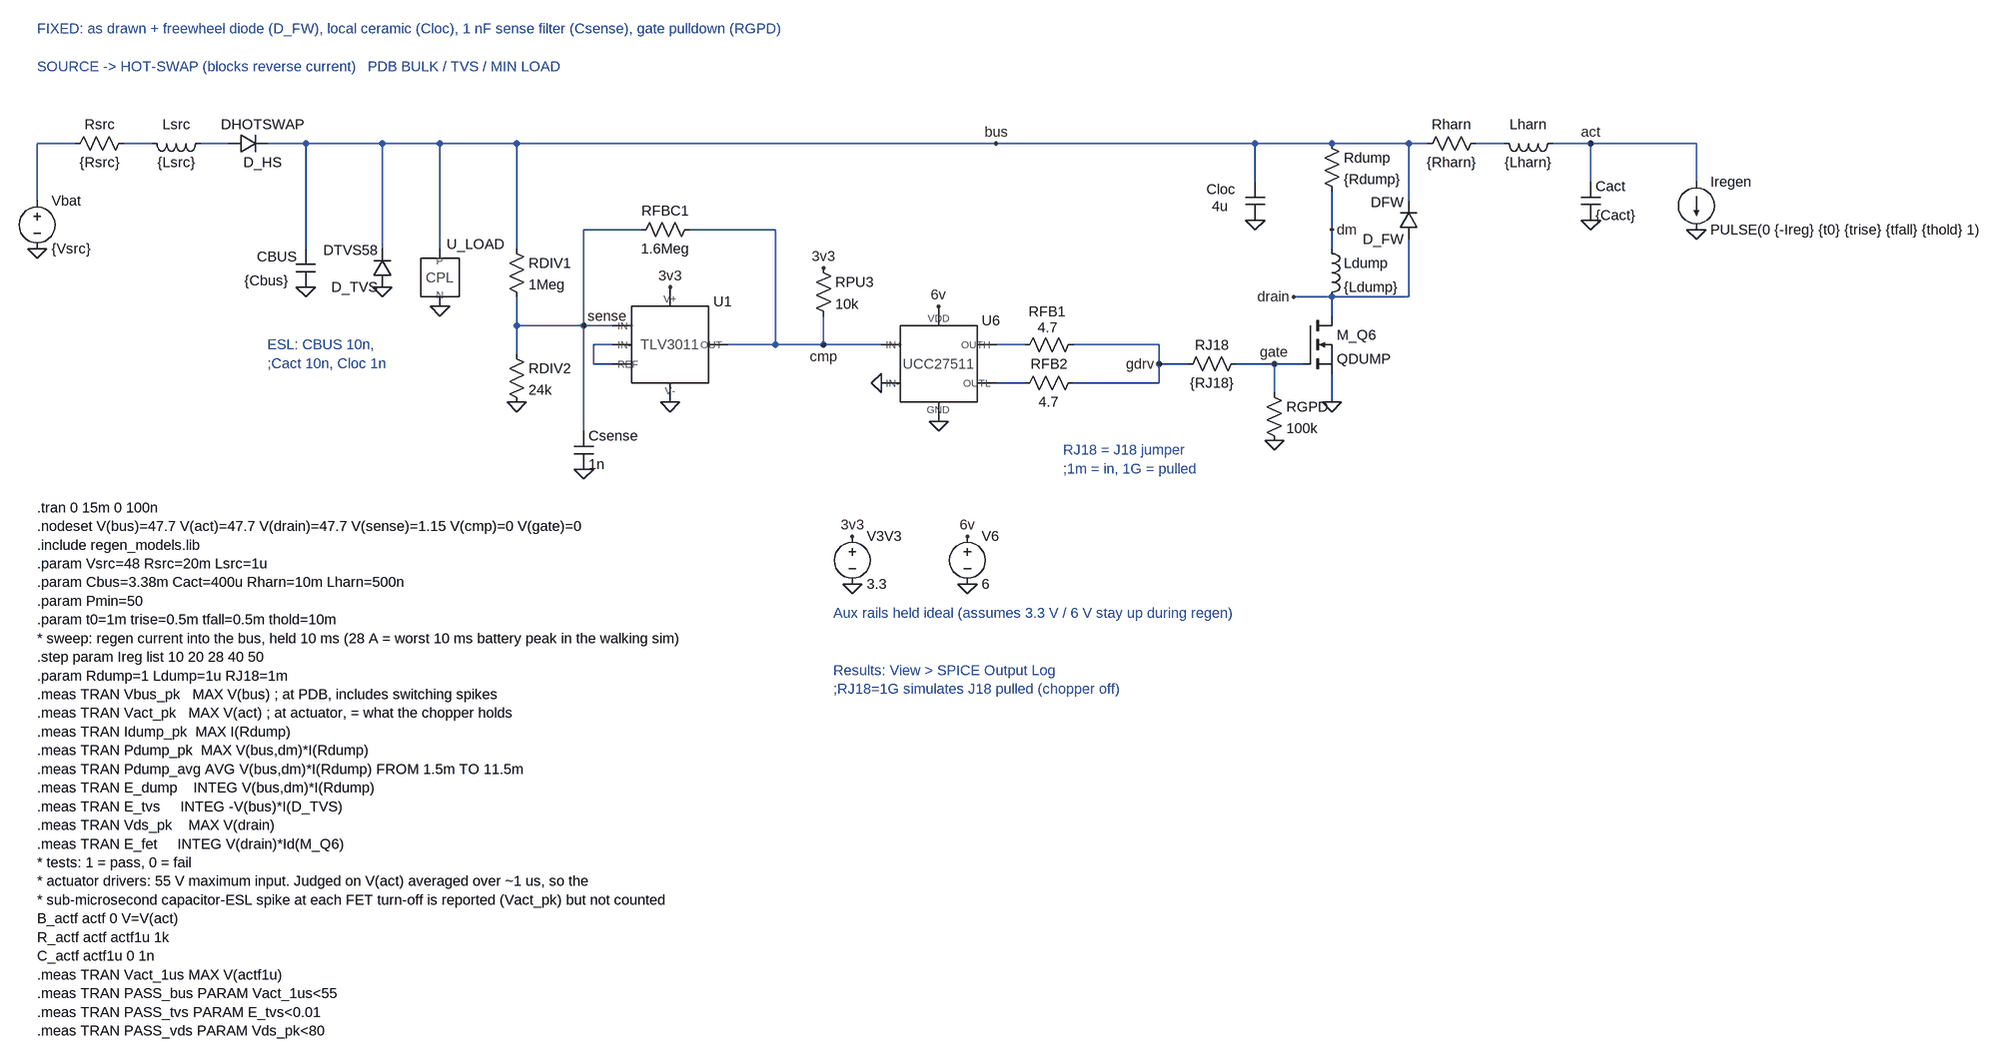
[diagram p0: schematic regen_current_sweep.asc]
regen_current_sweep.asc, the LTspice schematic file:
Version 4.1
SHEET 1 3344 1360
WIRE 64 64 0 64
WIRE 192 64 144 64
WIRE 320 64 272 64
WIRE 448 64 384 64
WIRE 576 64 448 64
WIRE 672 64 576 64
WIRE 800 64 672 64
WIRE 1600 64 800 64
WIRE 2032 64 1600 64
WIRE 2160 64 2032 64
WIRE 2288 64 2160 64
WIRE 2320 64 2288 64
WIRE 2448 64 2400 64
WIRE 2592 64 2528 64
WIRE 2768 64 2592 64
WIRE 2032 128 2032 64
WIRE 2592 128 2592 64
WIRE 2768 128 2768 64
WIRE 0 160 0 64
WIRE 2288 160 2288 64
WIRE 1008 208 912 208
WIRE 1232 208 1088 208
WIRE 2160 208 2160 144
WIRE 448 240 448 64
WIRE 576 240 576 64
WIRE 672 240 672 64
WIRE 800 240 800 64
WIRE 2160 240 2160 208
WIRE 2160 320 2096 320
WIRE 2288 320 2288 224
WIRE 2288 320 2160 320
WIRE 2160 352 2160 320
WIRE 800 368 800 320
WIRE 912 368 912 208
WIRE 912 368 800 368
WIRE 960 368 912 368
WIRE 960 400 928 400
WIRE 1232 400 1232 208
WIRE 1232 400 1152 400
WIRE 1312 400 1312 352
WIRE 1312 400 1232 400
WIRE 1408 400 1312 400
WIRE 1648 400 1600 400
WIRE 1872 400 1728 400
WIRE 800 416 800 368
WIRE 928 432 928 400
WIRE 960 432 928 432
WIRE 1872 432 1872 400
WIRE 1920 432 1872 432
WIRE 2064 432 2000 432
WIRE 2112 432 2064 432
WIRE 1648 464 1600 464
WIRE 1872 464 1872 432
WIRE 1872 464 1728 464
WIRE 2064 480 2064 432
WIRE 2160 496 2160 448
WIRE 912 544 912 368
FLAG 0 240 0
FLAG 1600 64 bus
FLAG 448 304 0
FLAG 576 304 0
FLAG 672 336 0
FLAG 800 496 0
FLAG 912 368 sense
FLAG 1056 304 3v3
FLAG 1056 496 0
FLAG 1312 400 cmp
FLAG 1312 272 3v3
FLAG 1408 464 0
FLAG 1504 336 6v
FLAG 1504 528 0
FLAG 1872 432 gdrv
FLAG 2064 432 gate
FLAG 2160 496 0
FLAG 2160 208 dm
FLAG 2096 320 drain
FLAG 2592 64 act
FLAG 2592 192 0
FLAG 2768 208 0
FLAG 1360 720 3v3
FLAG 1360 800 0
FLAG 1552 720 6v
FLAG 1552 800 0
FLAG 912 608 0
FLAG 2064 560 0
FLAG 2032 192 0
SYMBOL voltage 0 144 R0
SYMATTR InstName Vbat
SYMATTR Value {Vsrc}
SYMBOL res 160 48 R90
WINDOW 0 0 56 VBottom 2
WINDOW 3 32 56 VTop 2
SYMATTR InstName Rsrc
SYMATTR Value {Rsrc}
SYMBOL ind 288 48 R90
WINDOW 0 0 56 VBottom 2
WINDOW 3 32 56 VTop 2
SYMATTR InstName Lsrc
SYMATTR Value {Lsrc}
SYMBOL diode 320 80 R270
WINDOW 0 0 56 VBottom 2
WINDOW 3 32 56 VTop 2
SYMATTR InstName D_HS
SYMATTR Value DHOTSWAP
SYMBOL cap 432 240 R0
WINDOW 0 -65 13 Left 2
WINDOW 3 -86 53 Left 2
SYMATTR InstName CBUS
SYMATTR Value {Cbus}
SYMATTR SpiceLine Rser=10m Lser=10n
SYMBOL diode 592 304 R180
WINDOW 3 24 62 Left 2
SYMATTR Value DTVS58
SYMATTR InstName D_TVS
SYMBOL CPL_beh 672 240 R0
WINDOW 0 11 -8 Left 2
SYMATTR InstName U_LOAD
SYMBOL res 784 224 R0
SYMATTR InstName RDIV1
SYMATTR Value 1Meg
SYMBOL res 784 400 R0
SYMATTR InstName RDIV2
SYMATTR Value 24k
SYMBOL res 1104 192 R90
WINDOW 0 0 56 VBottom 2
WINDOW 3 32 56 VTop 2
SYMATTR InstName RFBC1
SYMATTR Value 1.6Meg
SYMBOL TLV3011_beh 1056 400 R0
SYMATTR InstName U1
SYMBOL res 1296 256 R0
SYMATTR InstName RPU3
SYMATTR Value 10k
SYMBOL UCC27511_beh 1504 432 R0
SYMATTR InstName U6
SYMBOL res 1744 384 R90
WINDOW 0 -24 59 VBottom 2
WINDOW 3 -28 58 VTop 2
SYMATTR InstName RFB1
SYMATTR Value 4.7
SYMBOL res 1744 448 R90
WINDOW 0 0 56 VBottom 2
WINDOW 3 32 56 VTop 2
SYMATTR InstName RFB2
SYMATTR Value 4.7
SYMBOL res 2016 416 R90
WINDOW 0 0 56 VBottom 2
WINDOW 3 32 56 VTop 2
SYMATTR InstName RJ18
SYMATTR Value {RJ18}
SYMBOL nmos 2112 352 R0
SYMATTR InstName M_Q6
SYMATTR Value QDUMP
SYMBOL res 2144 48 R0
SYMATTR InstName Rdump
SYMATTR Value {Rdump}
SYMBOL ind 2144 224 R0
SYMATTR InstName Ldump
SYMATTR Value {Ldump}
SYMBOL res 2416 48 R90
WINDOW 0 0 56 VBottom 2
WINDOW 3 32 56 VTop 2
SYMATTR InstName Rharn
SYMATTR Value {Rharn}
SYMBOL ind 2544 48 R90
WINDOW 0 0 56 VBottom 2
WINDOW 3 32 56 VTop 2
SYMATTR InstName Lharn
SYMATTR Value {Lharn}
SYMBOL cap 2576 128 R0
SYMATTR InstName Cact
SYMATTR Value {Cact}
SYMATTR SpiceLine Rser=20m Lser=10n
SYMBOL current 2768 128 R0
SYMATTR InstName Iregen
SYMATTR Value PULSE(0 {-Ireg} {t0} {trise} {tfall} {thold} 1)
SYMBOL voltage 1360 704 R0
SYMATTR InstName V3V3
SYMATTR Value 3.3
SYMBOL voltage 1552 704 R0
SYMATTR InstName V6
SYMATTR Value 6
SYMBOL cap 896 544 R0
SYMATTR InstName Csense
SYMATTR Value 1n
SYMBOL res 2048 464 R0
SYMATTR InstName RGPD
SYMATTR Value 100k
SYMBOL cap 2016 128 R0
WINDOW 0 -65 13 Left 2
WINDOW 3 -56 41 Left 2
SYMATTR InstName Cloc
SYMATTR Value 4u
SYMATTR SpiceLine Rser=5m Lser=1n
SYMBOL diode 2304 224 R180
WINDOW 3 24 62 Left 2
SYMATTR Value DFW
SYMATTR InstName D_FW
TEXT 0 -64 Left 2 ;SOURCE -> HOT-SWAP (blocks reverse current)
TEXT 552 -64 Left 2 ;PDB BULK / TVS / MIN LOAD
TEXT 1712 576 Left 2 ;RJ18 = J18 jumper\n;1m = in, 1G = pulled
TEXT 384 400 Left 2 ;ESL: CBUS 10n,\n;Cact 10n, Cloc 1n
TEXT 0 -128 Left 2 ;FIXED: as drawn + freewheel diode (D_FW), local ceramic (Cloc), 1 nF sense filter (Csense), gate pulldown (RGPD)
TEXT 1328 848 Left 2 ;Aux rails held ideal (assumes 3.3 V / 6 V stay up during regen)
TEXT 0 672 Left 2 !.tran 0 15m 0 100n\n.nodeset V(bus)=47.7 V(act)=47.7 V(drain)=47.7 V(sense)=1.15 V(cmp)=0 V(gate)=0\n.include regen_models.lib\n.param Vsrc=48 Rsrc=20m Lsrc=1u\n.param Cbus=3.38m Cact=400u Rharn=10m Lharn=500n\n.param Pmin=50\n.param t0=1m trise=0.5m tfall=0.5m thold=10m\n* sweep: regen current into the bus, held 10 ms (28 A = worst 10 ms battery peak in the walking sim)\n.step param Ireg list 10 20 28 40 50\n.param Rdump=1 Ldump=1u RJ18=1m\n.meas TRAN Vbus_pk   MAX V(bus) ; at PDB, includes switching spikes\n.meas TRAN Vact_pk   MAX V(act) ; at actuator, = what the chopper holds\n.meas TRAN Idump_pk  MAX I(Rdump)\n.meas TRAN Pdump_pk  MAX V(bus,dm)*I(Rdump)\n.meas TRAN Pdump_avg AVG V(bus,dm)*I(Rdump) FROM 1.5m TO 11.5m\n.meas TRAN E_dump    INTEG V(bus,dm)*I(Rdump)\n.meas TRAN E_tvs     INTEG -V(bus)*I(D_TVS)\n.meas TRAN Vds_pk    MAX V(drain)\n.meas TRAN E_fet     INTEG V(drain)*Id(M_Q6)\n* tests: 1 = pass, 0 = fail\n* actuator drivers: 55 V maximum input. Judged on V(act) averaged over ~1 us, so the\n* sub-microsecond capacitor-ESL spike at each FET turn-off is reported (Vact_pk) but not counted\nB_actf actf 0 V=V(act)\nR_actf actf actf1u 1k\nC_actf actf1u 0 1n\n.meas TRAN Vact_1us MAX V(actf1u)\n.meas TRAN PASS_bus PARAM Vact_1us<55\n.meas TRAN PASS_tvs PARAM E_tvs<0.01\n.meas TRAN PASS_vds PARAM Vds_pk<80
TEXT 1328 944 Left 2 ;Results: View > SPICE Output Log \n;RJ18=1G simulates J18 pulled (chopper off)

The netlist it stands for:
* regen_current_sweep.asc
Vbat N001 0 {Vsrc}
Rsrc N002 N001 {Rsrc}
Lsrc N003 N002 {Lsrc}
D_HS N003 bus DHOTSWAP
CBUS bus 0 {Cbus} Rser=10m Lser=10n
D_TVS 0 bus DTVS58
X§U_LOAD bus 0 CPL_BEH  ; pins P N
RDIV1 bus sense 1Meg
RDIV2 sense 0 24k
RFBC1 cmp sense 1.6Meg
X§U1 sense N005 N005 cmp 3v3 0 TLV3011_BEH  ; pins IN+ IN- REF OUT V+ V-
RPU3 3v3 cmp 10k
X§U6 cmp 0 6v N006 N007 0 UCC27511_BEH  ; pins IN+ IN- VDD OUTH OUTL GND
RFB1 gdrv N006 4.7
RFB2 gdrv N007 4.7
RJ18 gate gdrv {RJ18}
M_Q6 drain gate 0 0 QDUMP
Rdump bus dm {Rdump}
Ldump dm drain {Ldump}
Rharn N004 bus {Rharn}
Lharn act N004 {Lharn}
Cact act 0 {Cact} Rser=20m Lser=10n
Iregen act 0 PULSE(0 {-Ireg} {t0} {trise} {tfall} {thold} 1)
V3V3 3v3 0 3.3
V6 6v 0 6
Csense sense 0 1n
RGPD gate 0 100k
Cloc bus 0 4u Rser=5m Lser=1n
D_FW drain bus DFW
.model D D
.lib standard.dio
.model NMOS NMOS
.model PMOS PMOS
.lib standard.mos
* SOURCE -> HOT-SWAP (blocks reverse current)
* PDB BULK / TVS / MIN LOAD
* RJ18 = J18 jumper
* ;1m = in, 1G = pulled
* ESL: CBUS 10n,
* ;Cact 10n, Cloc 1n
* FIXED: as drawn + freewheel diode (D_FW), local ceramic (Cloc), 1 nF sense filter (Csense), gate pulldown (RGPD)
* Aux rails held ideal (assumes 3.3 V / 6 V stay up during regen)
.tran 0 15m 0 100n
.nodeset V(bus)=47.7 V(act)=47.7 V(drain)=47.7 V(sense)=1.15 V(cmp)=0 V(gate)=0
.include regen_models.lib
.param Vsrc=48 Rsrc=20m Lsrc=1u
.param Cbus=3.38m Cact=400u Rharn=10m Lharn=500n
.param Pmin=50
.param t0=1m trise=0.5m tfall=0.5m thold=10m
* sweep: regen current into the bus, held 10 ms (28 A = worst 10 ms battery peak in the walking sim)
.step param Ireg list 10 20 28 40 50
.param Rdump=1 Ldump=1u RJ18=1m
.meas TRAN Vbus_pk   MAX V(bus) ; at PDB, includes switching spikes
.meas TRAN Vact_pk   MAX V(act) ; at actuator, = what the chopper holds
.meas TRAN Idump_pk  MAX I(Rdump)
.meas TRAN Pdump_pk  MAX V(bus,dm)*I(Rdump)
.meas TRAN Pdump_avg AVG V(bus,dm)*I(Rdump) FROM 1.5m TO 11.5m
.meas TRAN E_dump    INTEG V(bus,dm)*I(Rdump)
.meas TRAN E_tvs     INTEG -V(bus)*I(D_TVS)
.meas TRAN Vds_pk    MAX V(drain)
.meas TRAN E_fet     INTEG V(drain)*Id(M_Q6)
* tests: 1 = pass, 0 = fail
* actuator drivers: 55 V maximum input. Judged on V(act) averaged over ~1 us, so the
* sub-microsecond capacitor-ESL spike at each FET turn-off is reported (Vact_pk) but not counted
B_actf actf 0 V=V(act)
R_actf actf actf1u 1k
C_actf actf1u 0 1n
.meas TRAN Vact_1us MAX V(actf1u)
.meas TRAN PASS_bus PARAM Vact_1us<55
.meas TRAN PASS_tvs PARAM E_tvs<0.01
.meas TRAN PASS_vds PARAM Vds_pk<80
* Results: View > SPICE Output Log
* ;RJ18=1G simulates J18 pulled (chopper off)
.backanno
.end